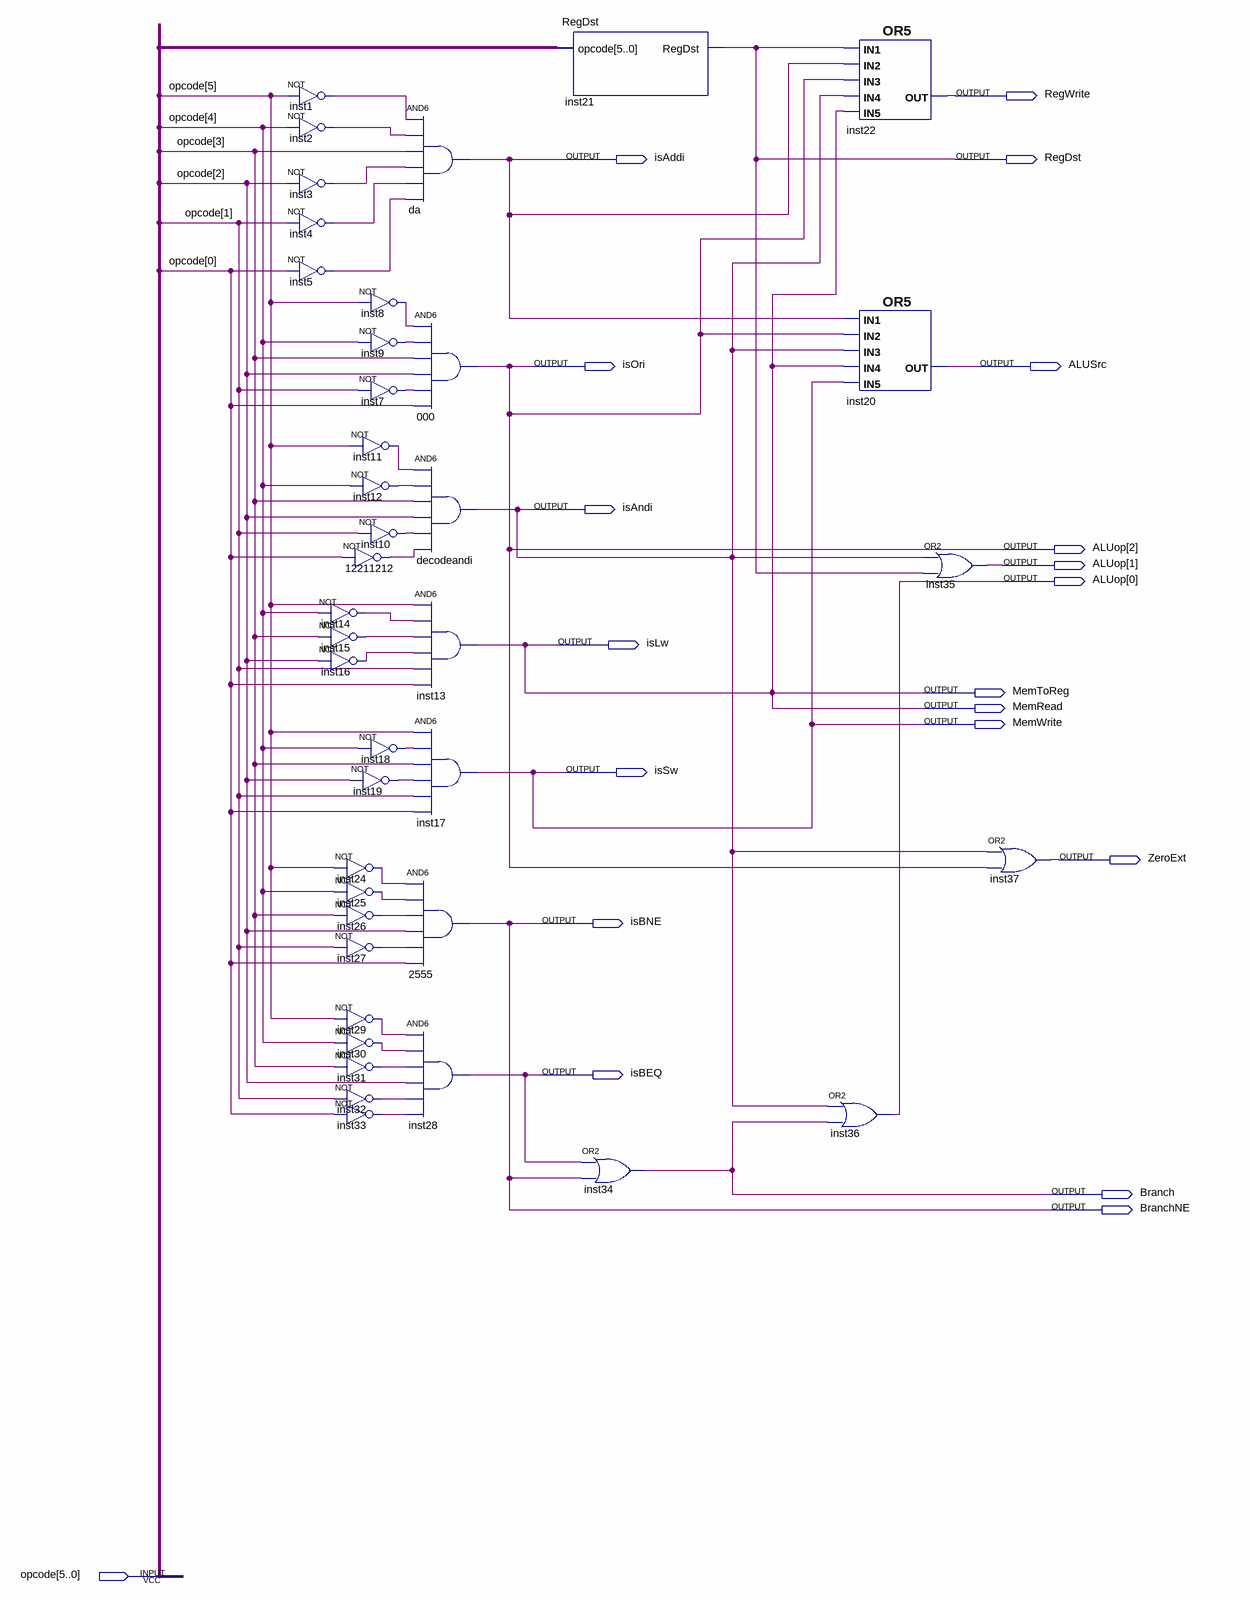
[diagram p0: schematic sheet]
// Quartus schematic ControlUnit.bdf as structural Verilog: 40 symbols, 20 pins
module ControlUnit (
  input  [5:0] opcode,
  output RegWrite,
  output isAddi,
  output RegDst,
  output isOri,
  output ALUSrc,
  output isAndi,
  output [2:0] ALUop,
  output isLw,
  output MemToReg,
  output MemRead,
  output MemWrite,
  output isSw,
  output ZeroExt,
  output isBNE,
  output isBEQ,
  output Branch,
  output BranchNE
);

  wire inst1_out, inst2_out, inst3_out, inst4_out, inst5_out, inst7_out, inst8_out, inst9_out, inst10_out,
       inst11_out, inst12_out, inst14_out, inst15_out, inst16_out, inst18_out, inst19_out, inst24_out,
       inst25_out, inst26_out, inst27_out, inst29_out, inst30_out, inst31_out, inst32_out, inst33_out,
       n12211212_out;

  not inst1 (inst1_out, opcode[5]);
  not inst2 (inst2_out, opcode[4]);
  not inst3 (inst3_out, opcode[2]);
  not inst4 (inst4_out, opcode[1]);
  not inst5 (inst5_out, opcode[0]);
  not inst14 (inst14_out, opcode[4]);
  not inst15 (inst15_out, opcode[3]);
  not inst16 (inst16_out, opcode[2]);
  not inst8 (inst8_out, opcode[5]);
  not inst9 (inst9_out, opcode[4]);
  not inst7 (inst7_out, opcode[1]);
  not inst11 (inst11_out, opcode[5]);
  not inst12 (inst12_out, opcode[4]);
  not inst10 (inst10_out, opcode[1]);
  not u_12211212 (n12211212_out, opcode[0]);
  not inst18 (inst18_out, opcode[4]);
  not inst19 (inst19_out, opcode[2]);
  not inst24 (inst24_out, opcode[5]);
  not inst25 (inst25_out, opcode[4]);
  not inst26 (inst26_out, opcode[3]);
  not inst27 (inst27_out, opcode[1]);
  not inst29 (inst29_out, opcode[5]);
  not inst30 (inst30_out, opcode[4]);
  not inst31 (inst31_out, opcode[3]);
  not inst32 (inst32_out, opcode[1]);
  not inst33 (inst33_out, opcode[0]);
  and da (isAddi, inst1_out, inst2_out, opcode[3], inst3_out, inst4_out, inst5_out);
  and u_000 (ALUop[2], inst8_out, inst9_out, opcode[3], opcode[2], inst7_out, opcode[0]);
  and decodeandi (isAndi, inst11_out, inst12_out, opcode[3], opcode[2], inst10_out, n12211212_out);
  and inst13 (isLw, opcode[5], inst14_out, inst15_out, inst16_out, opcode[1], opcode[0]);
  and inst17 (isSw, opcode[5], inst18_out, opcode[3], inst19_out, opcode[1], opcode[0]);
  and u_2555 (BranchNE, inst24_out, inst25_out, inst26_out, opcode[2], inst27_out, opcode[0]);
  and inst28 (isBEQ, inst29_out, inst30_out, inst31_out, opcode[2], inst32_out, inst33_out);
  RegDst inst21 (.opcode(opcode), .RegDst(RegDst));
  or inst34 (Branch, isBEQ, BranchNE);
  or inst36 (ALUop[0], isAndi, Branch);
  or inst22 (RegWrite, RegDst, isAddi, ALUop[2], isAndi, isLw);
  or inst20 (ALUSrc, isAddi, ALUop[2], isAndi, isLw, isSw);
  or inst35 (ALUop[1], isAndi, RegDst);
  or inst37 (ZeroExt, isAndi, ALUop[2]);

  assign isBNE = BranchNE;
  assign isOri = ALUop[2];
  assign MemRead = isLw;
  assign MemToReg = isLw;
  assign MemWrite = isSw;
endmodule
